# Altium schematic sheet Komunikacija.SchDoc
size A3; SheetNumber: 6; SheetTotal: 6
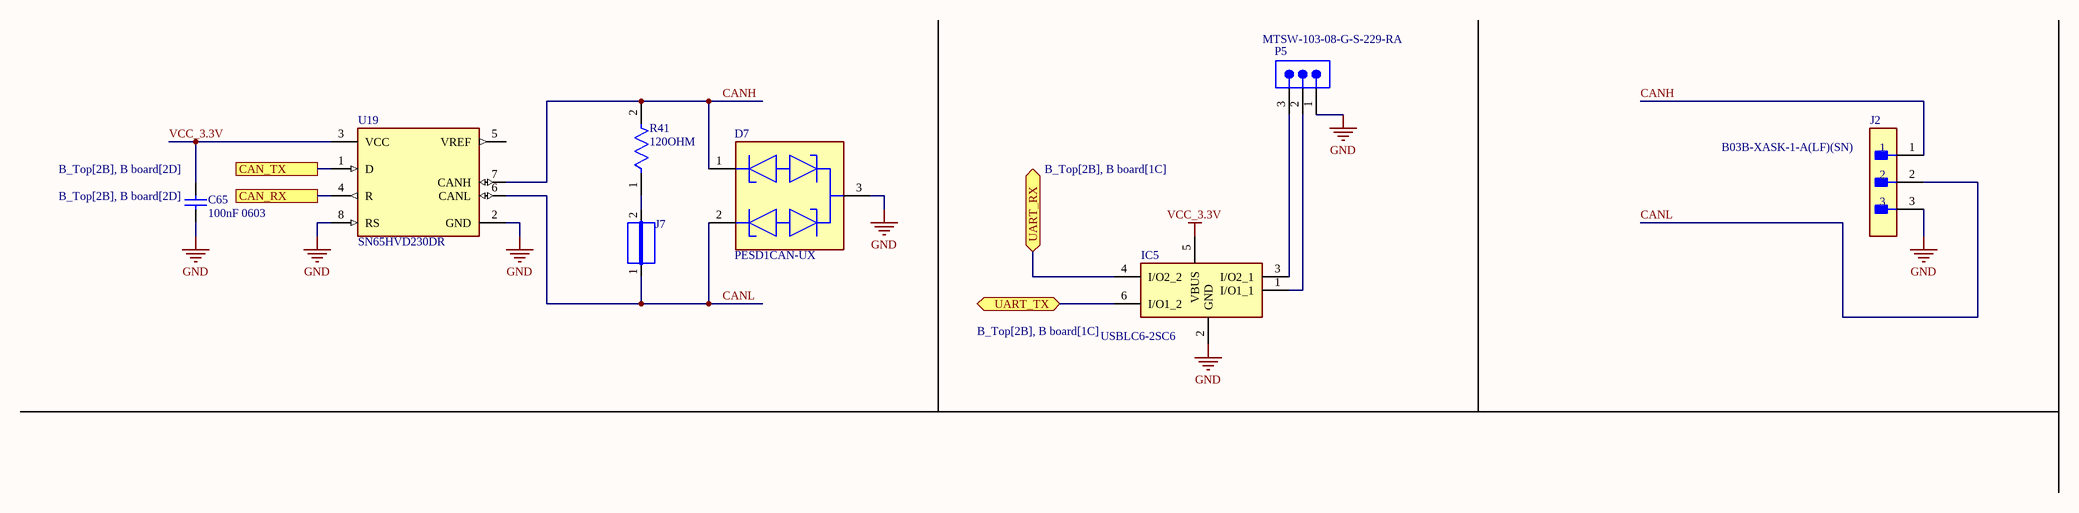
[diagram p0: Komunikacija.SchDoc]

## Parts
C65  100nF 0603  [CAPC1608X90X35NL15T15]
D7  PESD1CAN-UX  [FP-SOT323-MFG]
IC5  USBLC6-2SC6  [SOT95P280X145-6N]
J2  B03B-XASK-1-A(LF)(SN)  [FP-B03B-XASK-1-A_LF_SN-MFG]
J7  JUMPER  [JUMPER]  (value not drawn)
P5  MTSW-103-08-G-S-229-RA  [SMTC-MTSW-103-08-X-S-229-RA]
R41  120OHM  [FP-RMCF0201-IPC_B]
U19  SN65HVD230DR  [FP-D0008A-IPC_A]

## Ports
CAN_RX (see B_Top[2B], B board[2D]), CAN_TX (see B_Top[2B], B board[2D]), UART_RX (bidir, see B_Top[2B], B board[1C]), UART_TX (bidir, see B_Top[2B], B board[1C])

## Nets
GND: C65.1 D7.3(common_cathode) IC5.2(GND) J2.3 P5.1 U19.2(GND) U19.8(RS)
VCC_3.3V: C65.2 IC5.5(VBUS) U19.3(VCC)
CAN_RX: U19.4(R) ; port CAN_RX
CAN_TX: U19.1(D) ; port CAN_TX
CANH: D7.1(cathode_1) J2.1 R41.2 U19.7(CANH)
CANL: D7.2(cathode_2) J2.2 J7.1 U19.6(CANL)
UART_RX: IC5.4(I/O2_2) ; port UART_RX
UART_TX: IC5.6(I/O1_2) ; port UART_TX
NetIC5_1: IC5.1(I/O1_1) P5.2
NetIC5_3: IC5.3(I/O2_1) P5.3
NetJ7_2: J7.2 R41.1

Not connected (* = marked no-connect by the designer): U19 5(VREF)

## Library data of the parts
C65 = CMP-2006-02299-1: Part Number: C0603C104K4RAC7013; Manufacturer: Kemet
D7 = CMP-14436-000006-1: TVS DIODE 24V 50V SC70-3
IC5 = USBLC6-2SC6: Integrated Circuit; Manufacturer_Name: STMicroelectronics; Datasheet Link: https://www.st.com/resource/en/datasheet/usblc6-2.pdf; Height: 1.45mm; Manufacturer_Part_Number: USBLC6-2SC6; Mouser Part Number: 511-USBLC6-2SC6; Mouser Price/Stock: https://www.mouser.co.uk/ProductDetail/STMicroelectronics/USBLC6-2SC6?qs=po45yt2pPpu%2FhNIlwQdTlg%3D%3D; Arrow Part Number: USBLC6-2SC6; Arrow Price/Stock: https://www.arrow.com/en/products/usblc6-2sc6/stmicroelectronics.html?utm_currency=USD&region=asia
J2 = CMP-17439-000540-1: CONN HEADER VERT 3POS 2.5MM; Number of Positions: 3; Voltage Rating: 250V; Mated Stacking Heights: 11.3mm; Contact Shape: Circular; Pitch: 2.5mm; Lead Free: Lead Free; Connector Type: Header; Flammability Rating: UL94 V-0; Contact Material: Copper Alloy; Packaging: Bulk; Insulation Color: Natural; Fastening Type: Ramp; Contact Type: Male Pin; Series: XA; Termination: Press-Fit; Contact Finish - Mating: TIN; Insulation Material: Nylon; Number of Rows: 1; Mount: Through Hole
J7 = CMP-009-00061-2: Pins: 2
P5 = CMP-1024-00100-1: Modified .025" SQ Post Header, Through-hole, Right Angle, -55 to 125 degC, 2.54 mm Pitch, 3-Pin, Male, RoHS; Manufacturer: Samtec; Pitch: 2.54 mm; ComponentLink1URL: http://www.samtec.com; ComponentLink3Description: Package Specification; Mounting Technology: Through-hole; PackageDescription: Assembly .025" [.64] SQ Post Terminal Strip; ComponentLink2URL: http://www.samtec.com/documents/webfiles/pdf/MTSW.PDF; PackageVersion: BI, 2/1987; ComponentLink1Description: Manufacturer URL; PackageReference: MTSW-103-08-X-S-229-RA; Orientation: Right Angle; DatasheetVersion: F-214; PartNumber: MTSW-103-08-G-S-229-RA; RoHS: True; Temperature Range: -55 to 125 degC; ComponentLink3URL: http://www.samtec.com/documents/webfiles/cpdf/MTSW-XXX-XX-X-X-XXXX-XX-XXX-MKT1.pdf; ComponentLink2Description: Datasheet
R41 = CMP-26527-005399-1: 120Ω ±5% 0.05W 0201 Thick Film Chip Resistor AEC-Q200 compliant; Resistance: 120R; Temperature Coefficient: 200ppm/°C; Max Power Dissipation: 50mW; Number of Terminations: 2; Mount: Surface Mount; Resistor Type: Thick Film; RoHS Compliant: Yes; Case/Package: 0201; Width: 0.012inch; Max Operating Temperature: 125°C; Tolerance: 5%; Radiation Hardening: No; Case Code (Metric): 0603; Min Operating Temperature: -55°C; Height: 0.009inch; Length: 0.024inch; Contact Plating: Tin; Case Code (Imperial): 0201; Packaging: Tape and Reel
U19 = CMP-0315-00015-3: IC TRANSCEIVER HALF 1/1 8SOIC; Number of Transceivers: 1; Operating Supply Voltage: 3.3V; Number of I/Os: 2; Max Supply Current: 17mA; Max Supply Voltage: 3.6V; Min Supply Voltage: 3V; Data Rate: 1Mbps; Min Operating Temperature: -40°C; Packaging: Tape and Reel; Lead Free: Lead Free; Number of Transmit Buffers: 1; Max Operating Temperature: 85°C; Number of Receive Buffers: 1; Number of Pins: 8; Package Quantity: 1; Radiation Hardening: No; Case/Package: D; REACH SVHC: No SVHC; Weight: 0.002561oz; Termination: SMD/SMT; Contact Plating: Gold; Nominal Supply Current: 17mA; Number of Receivers: 1; Number of Drivers: 1